# Altium project DIO_8SMA_8MCX_MEZZ.PrjPcb
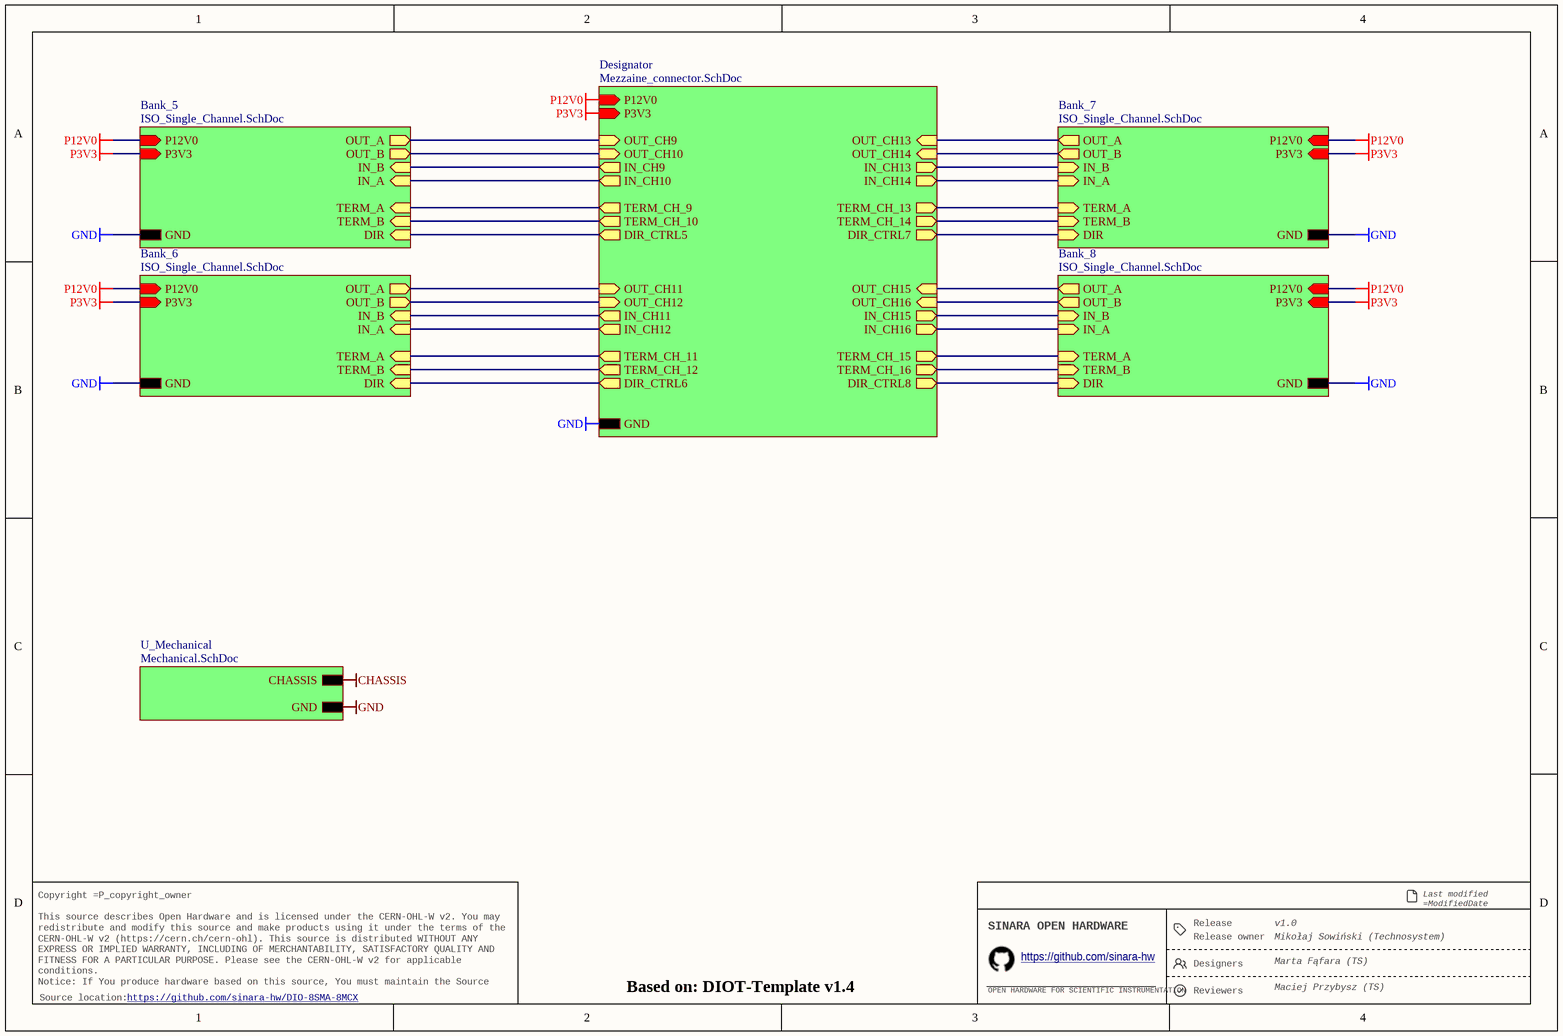
[diagram p0: DIO_8SMA_8MCX_MEZZ.SchDoc]
P_copyright_owner: Technosystem 2026; P_github_link: https://github.com/sinara-hw/DIO-8SMA-8MCX; P_release_designers: Marta Fąfara (TS); P_release_owner: Mikołaj Sowiński (Technosystem); P_release_reviewers: Maciej Przybysz (TS); P_template_version: 1.4; P_version: 1.0
6 sheets, 303 parts. Net scope: strictly hierarchical (ports join the sheet entries above them; power ports are local).
Board file: DIO_8SMA_8MCX_MEZZ.PcbDoc
Sheets:
  DIO_8SMA_8MCX_MEZZ.SchDoc
    Bank_5 = ISO_Single_Channel.SchDoc
      ISO_DCDC = ISO_DC_12_DC_5.SchDoc
      Bank = Iso_SMA_MCX_Channel.SchDoc
    Bank_6 = ISO_Single_Channel.SchDoc
      ISO_DCDC = ISO_DC_12_DC_5.SchDoc
      Bank = Iso_SMA_MCX_Channel.SchDoc
    Bank_7 = ISO_Single_Channel.SchDoc
      ISO_DCDC = ISO_DC_12_DC_5.SchDoc
      Bank = Iso_SMA_MCX_Channel.SchDoc
    Bank_8 = ISO_Single_Channel.SchDoc
      ISO_DCDC = ISO_DC_12_DC_5.SchDoc
      Bank = Iso_SMA_MCX_Channel.SchDoc
    U_Mechanical = Mechanical.SchDoc
    Designator = Mezzaine_connector.SchDoc

## Sheet DIO_8SMA_8MCX_MEZZ.SchDoc: =DocumentName
size A4; DocumentNumber: 1; Revision: 0; SheetNumber: 1; SheetTotal: 6

### Sub-sheets
Bank_5 = ISO_Single_Channel.SchDoc: P12V0 (in), GND, OUT_A (out), OUT_B (out), IN_B (in), IN_A (in), TERM_A (in), DIR (in), TERM_B (in), P3V3 (in)
Bank_6 = ISO_Single_Channel.SchDoc: P12V0 (in), GND, OUT_A (out), OUT_B (out), IN_B (in), IN_A (in), TERM_A (in), DIR (in), TERM_B (in), P3V3 (in)
Bank_7 = ISO_Single_Channel.SchDoc: P12V0 (in), GND, OUT_A (out), OUT_B (out), IN_B (in), IN_A (in), TERM_A (in), DIR (in), TERM_B (in), P3V3 (in)
Bank_8 = ISO_Single_Channel.SchDoc: P12V0 (in), GND, OUT_A (out), OUT_B (out), IN_B (in), IN_A (in), TERM_A (in), DIR (in), TERM_B (in), P3V3 (in)
Designator = Mezzaine_connector.SchDoc: P12V0 (in), P3V3 (in), GND, OUT_CH9 (in), IN_CH9 (out), TERM_CH_9 (out), DIR_CTRL5 (out), OUT_CH10 (in), IN_CH10 (out), TERM_CH_10 (out), OUT_CH13 (in), OUT_CH14 (in), IN_CH13 (out), IN_CH14 (out), TERM_CH_13 (out), TERM_CH_14 (out), DIR_CTRL7 (out), DIR_CTRL6 (out), TERM_CH_12 (out), TERM_CH_11 (out), IN_CH12 (out), IN_CH11 (out), OUT_CH12 (in), OUT_CH11 (in), DIR_CTRL8 (out), TERM_CH_16 (out), TERM_CH_15 (out), IN_CH16 (out), IN_CH15 (out), OUT_CH16 (in), OUT_CH15 (in)
U_Mechanical = Mechanical.SchDoc: CHASSIS, GND

### Nets
GND: sheet Bank_5/GND, sheet Bank_6/GND, sheet Bank_7/GND, sheet Bank_8/GND, sheet U_Mechanical/GND, sheet Designator/GND
P3V3: sheet Bank_5/P3V3, sheet Bank_6/P3V3, sheet Bank_7/P3V3, sheet Bank_8/P3V3, sheet Designator/P3V3
P12V0: sheet Bank_5/P12V0, sheet Bank_6/P12V0, sheet Bank_7/P12V0, sheet Bank_8/P12V0, sheet Designator/P12V0
DIR_CTRL5: sheet Bank_5/DIR, sheet Designator/DIR_CTRL5
DIR_CTRL6: sheet Bank_6/DIR, sheet Designator/DIR_CTRL6
DIR_CTRL7: sheet Bank_7/DIR, sheet Designator/DIR_CTRL7
DIR_CTRL8: sheet Bank_8/DIR, sheet Designator/DIR_CTRL8
IN_CH9: sheet Bank_5/IN_B, sheet Designator/IN_CH9
IN_CH10: sheet Bank_5/IN_A, sheet Designator/IN_CH10
IN_CH11: sheet Bank_6/IN_B, sheet Designator/IN_CH11
IN_CH12: sheet Bank_6/IN_A, sheet Designator/IN_CH12
IN_CH13: sheet Bank_7/IN_B, sheet Designator/IN_CH13
IN_CH14: sheet Bank_7/IN_A, sheet Designator/IN_CH14
IN_CH15: sheet Bank_8/IN_B, sheet Designator/IN_CH15
IN_CH16: sheet Bank_8/IN_A, sheet Designator/IN_CH16
OUT_CH9: sheet Bank_5/OUT_A, sheet Designator/OUT_CH9
OUT_CH10: sheet Bank_5/OUT_B, sheet Designator/OUT_CH10
OUT_CH11: sheet Bank_6/OUT_A, sheet Designator/OUT_CH11
OUT_CH12: sheet Bank_6/OUT_B, sheet Designator/OUT_CH12
OUT_CH13: sheet Bank_7/OUT_A, sheet Designator/OUT_CH13
OUT_CH14: sheet Bank_7/OUT_B, sheet Designator/OUT_CH14
OUT_CH15: sheet Bank_8/OUT_A, sheet Designator/OUT_CH15
OUT_CH16: sheet Bank_8/OUT_B, sheet Designator/OUT_CH16
TERM_CH_9: sheet Bank_5/TERM_A, sheet Designator/TERM_CH_9
TERM_CH_10: sheet Bank_5/TERM_B, sheet Designator/TERM_CH_10
TERM_CH_11: sheet Bank_6/TERM_A, sheet Designator/TERM_CH_11
TERM_CH_12: sheet Bank_6/TERM_B, sheet Designator/TERM_CH_12
TERM_CH_13: sheet Bank_7/TERM_A, sheet Designator/TERM_CH_13
TERM_CH_14: sheet Bank_7/TERM_B, sheet Designator/TERM_CH_14
TERM_CH_15: sheet Bank_8/TERM_A, sheet Designator/TERM_CH_15
TERM_CH_16: sheet Bank_8/TERM_B, sheet Designator/TERM_CH_16

### Notes on the sheet
- Release
- Last modified =ModifiedDate
  Sheet =sheetnumber of =sheettotal · Size A4
- Copyright =P_copyright_owner
  This source describes Open Hardware and is licensed under the CERN-OHL-W v2. You may redistribute and modify this source and make products using it under the terms of the CERN-OHL-W v2 (https://cern.ch/cern-ohl). This source is distributed WITHOUT ANY EXPRESS OR IMPLIED WARRANTY, INCLUDING OF MERCHANTABILITY, SATISFACTORY QUALITY AND FITNESS FOR A PARTICULAR PURPOSE. Please see the CERN-OHL-W v2 for applicable conditions.
  Notice: If You produce hardware based on this source, You must maintain the Source Location visible on the product, its packaging or its documentation.
- SINARA OPEN HARDWARE
- OPEN HARDWARE FOR SCIENTIFIC INSTRUMENTATION
- https://github.com/sinara-hw
- Release owner
- Designers
- Reviewers
- Source location:

## Sheet ISO_Single_Channel.SchDoc: =DocumentName
size A4; Version: 1.0; DocumentNumber: 1; Revision: 0; SheetNumber: 3; SheetTotal: 6
Used 4 times, as channels Bank_5, Bank_6, Bank_7, Bank_8. Parts and nets are listed once, with the designators drawn on the sheet.
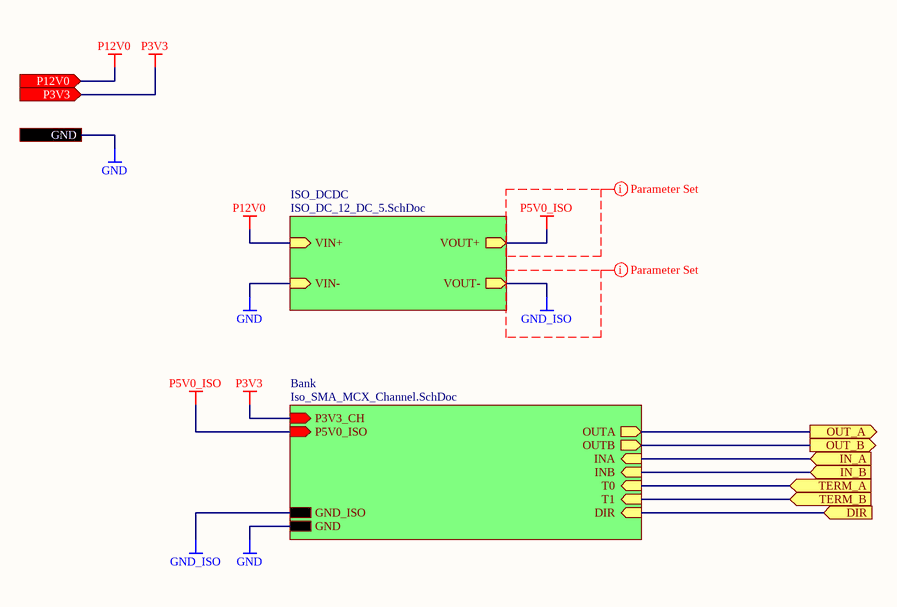
[diagram p1: ISO_Single_Channel.SchDoc]

### Sub-sheets
Bank = Iso_SMA_MCX_Channel.SchDoc: OUTA (out), OUTB (out), INA (in), INB (in), DIR (in), P3V3_CH (in), P5V0_ISO (in), GND_ISO, GND, T1 (in), T0 (in)
ISO_DCDC = ISO_DC_12_DC_5.SchDoc: VIN+ (in), VIN- (in), VOUT+ (out), VOUT- (out)

### Ports
DIR (in), GND, IN_A (in), IN_B (in), OUT_A (out), OUT_B (out), P3V3 (in), P12V0 (in), TERM_A (in), TERM_B (in)

### Nets
GND: port GND, sheet ISO_DCDC/VIN-, sheet Bank/GND
GND_ISO: sheet ISO_DCDC/VOUT-, sheet Bank/GND_ISO
P3V3: port P3V3, sheet Bank/P3V3_CH
P5V0_ISO: sheet ISO_DCDC/VOUT+, sheet Bank/P5V0_ISO
P12V0: port P12V0, sheet ISO_DCDC/VIN+
DIR: port DIR, sheet Bank/DIR
IN_A: port IN_A, sheet Bank/INA
IN_B: port IN_B, sheet Bank/INB
OUT_A: port OUT_A, sheet Bank/OUTA
OUT_B: port OUT_B, sheet Bank/OUTB
TERM_A: port TERM_A, sheet Bank/T0
TERM_B: port TERM_B, sheet Bank/T1

### Channels
Bank_5: ports DIR=DIR_CTRL5 GND=GND IN_A=IN_CH10 IN_B=IN_CH9 OUT_A=OUT_CH9 OUT_B=OUT_CH10 P3V3=P3V3 P12V0=P12V0 TERM_A=TERM_CH_9 TERM_B=TERM_CH_10
Bank_6: ports DIR=DIR_CTRL6 GND=GND IN_A=IN_CH12 IN_B=IN_CH11 OUT_A=OUT_CH11 OUT_B=OUT_CH12 P3V3=P3V3 P12V0=P12V0 TERM_A=TERM_CH_11 TERM_B=TERM_CH_12
Bank_7: ports DIR=DIR_CTRL7 GND=GND IN_A=IN_CH14 IN_B=IN_CH13 OUT_A=OUT_CH13 OUT_B=OUT_CH14 P3V3=P3V3 P12V0=P12V0 TERM_A=TERM_CH_13 TERM_B=TERM_CH_14
Bank_8: ports DIR=DIR_CTRL8 GND=GND IN_A=IN_CH16 IN_B=IN_CH15 OUT_A=OUT_CH15 OUT_B=OUT_CH16 P3V3=P3V3 P12V0=P12V0 TERM_A=TERM_CH_15 TERM_B=TERM_CH_16

### Layout directives
net class GND_ISO: GND_ISO
net class PWR_ISO: P5V0_ISO

### Notes on the sheet
- Release
- Last modified =ModifiedDate
  Sheet =sheetnumber of =sheettotal · Size A4
- Copyright =P_copyright_owner
  This source describes Open Hardware and is licensed under the CERN-OHL-W v2. You may redistribute and modify this source and make products using it under the terms of the CERN-OHL-W v2 (https://cern.ch/cern-ohl). This source is distributed WITHOUT ANY EXPRESS OR IMPLIED WARRANTY, INCLUDING OF MERCHANTABILITY, SATISFACTORY QUALITY AND FITNESS FOR A PARTICULAR PURPOSE. Please see the CERN-OHL-W v2 for applicable conditions.
  Notice: If You produce hardware based on this source, You must maintain the Source Location visible on the product, its packaging or its documentation.
- SINARA OPEN HARDWARE
- OPEN HARDWARE FOR SCIENTIFIC INSTRUMENTATION
- https://github.com/sinara-hw
- Release owner
- Designers
- Reviewers
- Source location:

## Sheet ISO_DC_12_DC_5.SchDoc: =DocumentName
size A4; ModifiedBy: -; CheckedDate: -; Title2: v1.0; DivGrp: WUT ISE; Designer: G.Kasprowicz; DocumentNumber: 1; Revision: 0; SheetNumber: 4; SheetTotal: 6
Used 4 times, as channels Bank_5/ISO_DCDC, Bank_6/ISO_DCDC, Bank_7/ISO_DCDC, Bank_8/ISO_DCDC. Parts and nets are listed once, with the designators drawn on the sheet.
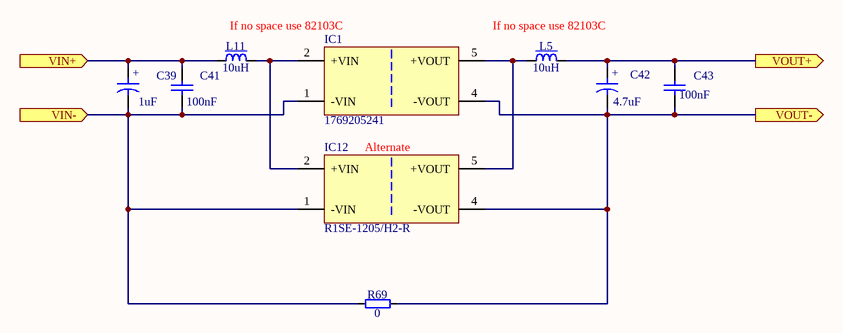
[diagram p2: ISO_DC_12_DC_5.SchDoc]

### Parts
C39  1uF  [CAPMP6032X280N]
C41  100nF  [CAPC1005X55N]
C42  4.7uF  [CAPMP3216X180N]
C43  100nF  [CAPC1005X55N]
IC1  1769205241  [WPME-FISM_SMT-8_L13.2W11.4H7.25]
IC12  R1SE-1205/H2-R  [R1SE-1205_H2-R]
L5  10uH  [IND_MURATA-PS_8400]
L11  10uH  [IND_MURATA-PS_8400]
R69  0  [RESC3216X65N]

### Ports
VIN+ (in), VIN- (in), VOUT+ (out), VOUT- (out)

### Nets
VIN+: C39.1 C41.2 L11.2 ; port VIN+
VIN-: C39.2 C41.1 IC1.1(-VIN) IC12.1(-VIN) R69.1 ; port VIN-
VOUT+: C42.1 C43.2 L5.1 ; port VOUT+
VOUT-: C42.2 C43.1 IC1.4(-VOUT) IC12.4(-VOUT) R69.2 ; port VOUT-
NetIC1_2: IC1.2(+VIN) IC12.2(+VIN) L11.1
NetIC1_5: IC1.5(+VOUT) IC12.5(+VOUT) L5.2

### Channels
Bank_5/ISO_DCDC: designators end in A; ports VIN+=P12V0 VIN-=GND VOUT+=P5V0_ISO VOUT-=GND_ISO
Bank_6/ISO_DCDC: designators end in B; ports VIN+=P12V0 VIN-=GND VOUT+=P5V0_ISO VOUT-=GND_ISO
Bank_7/ISO_DCDC: designators end in C; ports VIN+=P12V0 VIN-=GND VOUT+=P5V0_ISO VOUT-=GND_ISO
Bank_8/ISO_DCDC: designators end in D; ports VIN+=P12V0 VIN-=GND VOUT+=P5V0_ISO VOUT-=GND_ISO

### Notes on the sheet
- If no space use 82103C
- (near IC12) Alternate
- Release
- Last modified =ModifiedDate
  Sheet =sheetnumber of =sheettotal · Size A4
- Copyright =P_copyright_owner
  This source describes Open Hardware and is licensed under the CERN-OHL-W v2. You may redistribute and modify this source and make products using it under the terms of the CERN-OHL-W v2 (https://cern.ch/cern-ohl). This source is distributed WITHOUT ANY EXPRESS OR IMPLIED WARRANTY, INCLUDING OF MERCHANTABILITY, SATISFACTORY QUALITY AND FITNESS FOR A PARTICULAR PURPOSE. Please see the CERN-OHL-W v2 for applicable conditions.
  Notice: If You produce hardware based on this source, You must maintain the Source Location visible on the product, its packaging or its documentation.
- SINARA OPEN HARDWARE
- OPEN HARDWARE FOR SCIENTIFIC INSTRUMENTATION
- https://github.com/sinara-hw
- Release owner
- Designers
- Reviewers
- Source location:
- (in symbol CTE3216-18_4.7UF_16V_10%_LESR2000) +
- (in symbol CTE6032-28_1UF_50V_10%) +

### Library data of the parts
C39 = CTE6032-28_1UF_50V_10%: Polarised capacitor; Part Description: Solid Tantalum Chip Capacitor; Manufacturer: GENERIC; Manufacturer1 Part Number: TAJC105K050R; Voltage: 50V; Tolerance: ±10%; Part Number: CTE6032-28_1UF_50V_10%; Component Kind: Standard; Component Type: Standard; Pin Count: 2; Value: 1uF; Status: Preferred; Manufacturer Part Number: CTE6032-28_1UF_50V_10%; Case: C; Mounted: Yes; Socket: No; SMD: Yes; Sense: No; Manufacturer1 Example: AVX; Manufacturer1 ComponentHeight: 2.8mm; HelpURL: \\cern.ch\dfs\Applications\Altium\Datasheets\CTE_AVX_TAJ.pdf; Author: CERN DEM JLC; CreateDate: 03.12.2007; LatestRevisionDate: 03.12.2007
C41 C43 = CC0402_100NF_50V_10%_X7R: Non-polarised capacitor; Part Description: SMD Multilayer Chip Ceramic Capacitor; Manufacturer: GENERIC; Manufacturer1 Part Number: GRM155R71H104KE14D; Voltage: 50V; TC: X7R; Tolerance: ±10%; Part Number: CC0402_100NF_50V_10%_X7R; Component Kind: Standard; Component Type: Standard; Pin Count: 2; Value: 100nF; Status: None; Manufacturer Part Number: CC0402_100NF_50V_10%_X7R; Case: 0402; Mounted: Yes; Socket: No; SMD: Yes; Sense: No; HelpURL: \\cern.ch\dfs\Applications\Altium\Datasheets\CC0402_MURATA_GRM155R71H104KE14D.pdf; Author: CERN DEM MR; CreateDate: 30.06.2017; LatestRevisionDate: 30.06.2017; Manufacturer1 Example: MURATA; Manufacturer1 ComponentHeight: 0.55mm
C42 = CTE3216-18_4.7UF_16V_10%_LESR2000: Polarised capacitor; Part Description: Low ESR 2R0 Solid Tantalum Chip Capacitor; Manufacturer: GENERIC; Manufacturer1 Part Number: TPSA475K016R2000; Voltage: 16V; Tolerance: ±10%; Part Number: CTE3216-18_4.7UF_16V_10%_LESR2000; Component Kind: Standard; Component Type: Standard; Pin Count: 2; Value: 4.7uF; Status: Preferred; Manufacturer Part Number: CTE3216-18_4.7UF_16V_10%_LESR2000; Case: A; Mounted: Yes; Socket: No; SMD: Yes; Sense: No; Manufacturer1 Example: AVX; Manufacturer1 ComponentHeight: 1.8mm; HelpURL: \\cern.ch\dfs\Applications\Altium\Datasheets\CTE-LESR_AVX_TPS.pdf; Author: CERN DEM JLC; CreateDate: 03.09.2012; LatestRevisionDate: 03.09.2012
IC1 = CMP-019-00162-2: Dc-Dc Converter, 5V, 0.2A Rohs Compliant: Yes; Manufacturer: Wurth Elektronik; Isolation Voltage: 3kV; Output Current: 200mA; Max Supply Voltage: 13.2V; Height: 7.25mm; Manufacturer Part Search: 1769205241; Width: 11.4mm; Length: 13.2mm
IC12 = CMP-019-00163-2: 1W DC/DC-Converter 'ECONOLINE' SMD 2kV unreg; V. In: 12; V. Out: 05; mA. Out: 200; Manufacturer: RECOM Power; Output Voltage: 5V; Max Supply Voltage: 13.2V; Max Operating Temperature: 100°C; Min Operating Temperature: -40°C; Mounting Technology: Surface Mount; Case/Package: SMD/SMT; Manufacturer Part Number: R1SE-1205/H2-R; Height: 6.7mm; Max Power Dissipation: 1W
L5 L11 = IND_10UH_10%_MURATA-PS_8400: Inductor With Core; Part Description: Miniature Surface Mount Power Inductor (8400 Serie); Manufacturer: MURATA POWER SOLUTIONS; Manufacturer Part Number: 84103C; Power: 950mA; Resistance: 0.24R; Tolerance: ±10%; Part Number: IND_10UH_10%_MURATA-PS_8400; Component Kind: Standard; Component Type: Standard; Pin Count: 2; Value: 10uH; Status: None; Mounted: Yes; Socket: No; SMD: Yes; Sense: No; ComponentHeight: 2.9mm; HelpURL: \\cern.ch\dfs\Applications\Altium\Datasheets\IND_MURATA-PS_8400.pdf; Author: CERN DEM JLC; CreateDate: 02.07.2012; LatestRevisionDate: 02.07.2012
R69 = R1206_0R_JUMPER: Resistor; Part Description: 2A (0.05R Max DC Resistance) Zero Ohm Jumper; Manufacturer: GENERIC; Manufacturer1 Part Number: NRC12Z0; PressFit: No; Part Number: R1206_0R_JUMPER; Component Kind: Standard; Component Type: Standard; Pin Count: 2; Value: 0; Status: Preferred; Manufacturer Part Number: R1206_0R_JUMPER; Case: 1206; Mounted: Yes; Sense: No; Socket: No; SMD: Yes; Manufacturer1 Example: NIC COMPONENT; Manufacturer1 ComponentHeight: 0.65mm; HelpURL: \\cern.ch\dfs\Applications\Altium\Datasheets\R1206_NIC_NRC.pdf; Author: CERN DEM JLC; CreateDate: 03.12.2007; LatestRevisionDate: 13.03.2008

## Sheet Iso_SMA_MCX_Channel.SchDoc: =DocumentName
size A4; Version: 1.0; DocumentNumber: 1; Revision: 0; SheetNumber: 5; SheetTotal: 6
Used 4 times, as channels Bank_5/Bank, Bank_6/Bank, Bank_7/Bank, Bank_8/Bank. Parts and nets are listed once, with the designators drawn on the sheet.
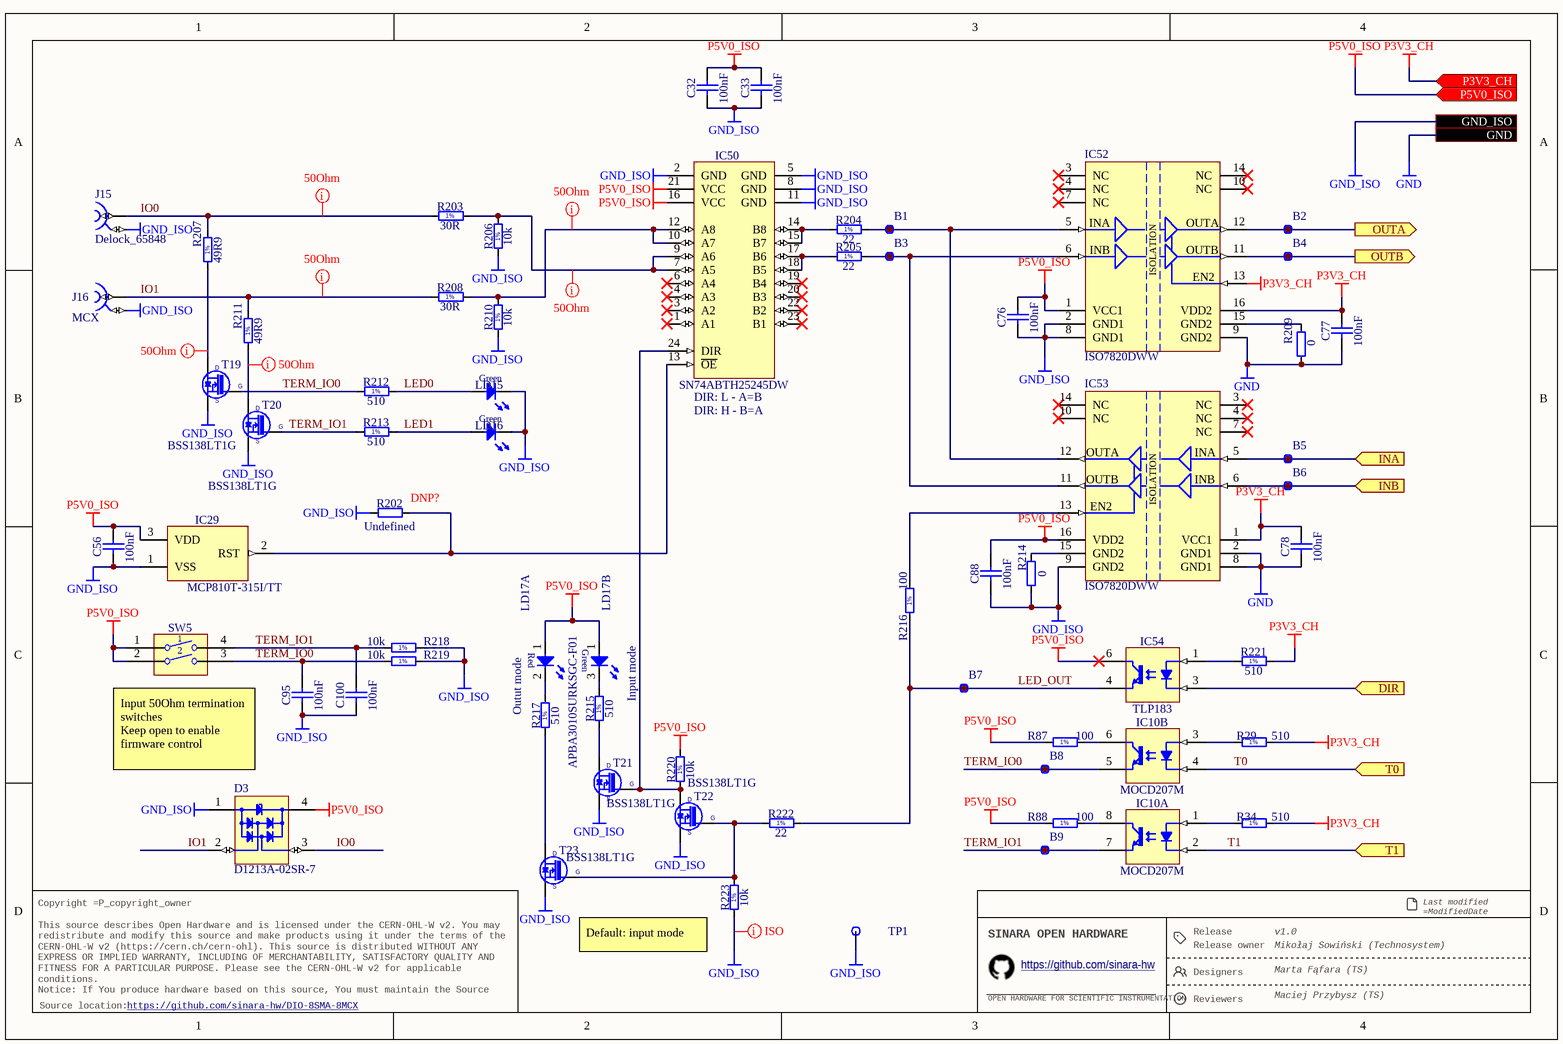
[diagram p3: Iso_SMA_MCX_Channel.SchDoc]

### Parts
B1  SMD Pad  [C100]  (value not drawn)  (no BOM)
B2  SMD Pad  [C100]  (value not drawn)  (no BOM)
B3  SMD Pad  [C100]  (value not drawn)  (no BOM)
B4  SMD Pad  [C100]  (value not drawn)  (no BOM)
B5  SMD Pad  [C100]  (value not drawn)  (no BOM)
B6  SMD Pad  [C100]  (value not drawn)  (no BOM)
B7  SMD Pad  [C100]  (value not drawn)  (no BOM)
B8  SMD Pad  [C100]  (value not drawn)  (no BOM)
B9  SMD Pad  [C100]  (value not drawn)  (no BOM)
C32  100nF  [CAPC1005X55N]
C33  100nF  [CAPC1005X55N]
C56  100nF  [CAPC1005X55N]
C76  100nF  [CAPC1005X55N]
C77  100nF  [CAPC1005X55N]
C78  100nF  [CAPC1005X55N]
C88  100nF  [CAPC1005X55N]
C95  100nF  [CAPC1005X55N]
C100  100nF  [CAPC1005X55N]
D3  D1213A-02SR-7  [SOT190P238X100-4N]
IC10  MOCD207M  [SOIC127P594X363-8N]  (parts A,B of 2)
IC29  MCP810T-315I/TT  [SOT95P237X112-3N]
IC50  SN74ABTH25245DW  [SOIC127P1030X265-24N]
IC52  ISO7820DWW  [SOIC127P1720X265-16N]
IC53  ISO7820DWW  [SOIC127P1720X265-16N]
IC54  TLP183  [TOSHIBA_11-4M1S]
J15  Delock_65848  [Delock_65848]
J16  MCX  [AMPHENOL_919-383J-51A]
LD15  Green  [LED_AVAGO_HSME-C120]
LD16  Green  [LED_AVAGO_HSME-C120]
LD17  APBA3010SURKSGC-F01  [APBA3010SURKSGC-F01]  (parts A,B of 2)
R29  510  [RESC1005X40N]
R34  510  [RESC1005X40N]
R87  100  [RESC1005X40N]
R88  100  [RESC1005X40N]
R202  Undefined  [RESC1005X40N]
R203  30R  [RESC3225X70N]
R204  22  [RESC1005X40N]
R205  22  [RESC1005X40N]
R206  10k  [RESC1005X40N]
R207  49R9  [RESC3225X70N]
R208  30R  [RESC3225X70N]
R209  0  [RESC1005X40N]
R210  10k  [RESC1005X40N]
R211  49R9  [RESC3225X70N]
R212  510  [RESC1005X40N]
R213  510  [RESC1005X40N]
R214  0  [RESC1005X40N]
R215  510  [RESC1005X40N]
R216  100  [RESC1005X40N]
R217  510  [RESC1005X40N]
R218  10k  [RESC1005X40N]
R219  10k  [RESC1005X40N]
R220  10k  [RESC1005X40N]
R221  510  [RESC1005X40N]
R222  22  [RESC1005X40N]
R223  10k  [RESC1005X40N]
SW5  Switch  [SW_OMRON_A6S-2102-H]  (value not drawn)
T19  BSS138LT1G  [SOT95P240X110-3N]
T20  BSS138LT1G  [SOT95P240X110-3N]
T21  BSS138LT1G  [SOT95P240X110-3N]
T22  BSS138LT1G  [SOT95P240X110-3N]
T23  BSS138LT1G  [SOT95P240X110-3N]
TP1  Plated Hole  [c150h100]  (value not drawn)  (no BOM)

### Ports
DIR (in), GND, GND_ISO, INA (in), INB (in), OUTA (out), OUTB (out), P3V3_CH (in), P5V0_ISO (in), T0 (in), T1 (in)

### Nets
GND: C77.1 C78.1 IC52.9(GND2) IC53.2(GND1) IC53.8(GND1) R209.2 ; port GND
GND_ISO: C32.1 C33.1 C56.1 C76.1 C88.1 C95.1 C100.1 D3.1(GND) IC29.1(VSS) IC50.2(GND) IC50.5(GND) IC50.8(GND) IC50.11(GND) IC52.2(GND1) IC52.8(GND1) IC53.9(GND2) J15.2 J16.2 LD15.1(C) LD16.1(C) R202.1 R206.1 R210.1 R214.1 R218.2 R219.2 R223.1 T19.2(S) T20.2(S) T21.2(S) T22.2(S) T23.2(S) TP1.1 ; port GND_ISO
P3V3_CH: C77.2 C78.2 IC52.13(EN2) IC52.16(VDD2) IC53.1(VCC1) R29.2 R34.2 R221.2 ; port P3V3_CH
P5V0_ISO: C32.2 C33.2 C56.2 C76.2 C88.2 D3.4(VCC) IC29.3(VDD) IC50.16(VCC) IC50.21(VCC) IC52.1(VCC1) IC53.16(VDD2) IC54.6(C) LD17.1(A) R87.1 R88.1 R220.2 SW5.1 SW5.2 ; port P5V0_ISO
DIR: IC54.3(C) ; port DIR
INA: B5.1 IC53.5(INA) ; port INA
INB: B6.1 IC53.6(INB) ; port INB
IO0: D3.3(I/O2) J15.1 R203.1 R207.2
IO1: D3.2(I/O1) J16.1 R208.1 R211.2
LED0: LD15.2(A) R212.2
LED1: LD16.2(A) R213.2
LED_OUT: B7.1 IC54.4(E) R216.1 R222.2
OUTA: B2.1 IC52.12(OUTA) ; port OUTA
OUTB: B4.1 IC52.11(OUTB) ; port OUTB
T0: IC10.4(K) ; port T0
T1: IC10.2(K) ; port T1
TERM_IO0: B8.1 C95.2 IC10.5(E) R212.1 R219.1 SW5.3 T19.1(G)
TERM_IO1: B9.1 C100.2 IC10.7(E) R213.1 R218.1 SW5.4 T20.1(G)
NetB1_1: B1.1 IC52.5(INA) IC53.12(OUTA) R204.2
NetB3_1: B3.1 IC52.6(INB) IC53.11(OUTB) R205.2
NetIC10_1: IC10.1(A) R34.1
NetIC10_3: IC10.3(A) R29.1
NetIC10_6: IC10.6(C) R87.2
NetIC10_8: IC10.8(C) R88.2
NetIC29_2: IC29.2(RST) IC50.13(~{OE}) R202.2
NetIC50_7: IC50.7(A5) IC50.9(A6) R203.2 R206.2
NetIC50_10: IC50.10(A7) IC50.12(A8) R208.2 R210.2
NetIC50_14: IC50.14(B8) IC50.15(B7) R204.1
NetIC50_17: IC50.17(B6) IC50.18(B5) R205.1
NetIC50_24: IC50.24(DIR) R220.1 T21.1(G) T22.3(D)
NetIC52_15: IC52.15(GND2) R209.1
NetIC53_13: IC53.13(EN2) R216.2
NetIC53_15: IC53.15(GND2) R214.2
NetIC54_1: IC54.1(A) R221.1
NetLD17_2: LD17.2(C) R217.2
NetLD17_3: LD17.3(C) R215.2
NetR207_1: R207.1 T19.3(D)
NetR211_1: R211.1 T20.3(D)
NetR215_1: R215.1 T21.3(D)
NetR217_1: R217.1 T23.3(D)
NetR222_1: R222.1 R223.2 T22.1(G) T23.1(G)

Not connected (* = marked no-connect by the designer): IC50 1(A1)* 3(A2)* 4(A3)* 6(A4)* 19(B4)* 20(B3)* 22(B2)* 23(B1)*; IC52 3(NC)* 4(NC)* 7(NC)* 10(NC)* 14(NC)*; IC53 3(NC)* 4(NC)* 7(NC)* 10(NC)* 14(NC)*

### Channels
Bank_5/Bank: designators end in A; ports DIR=DIR_CTRL5 GND=GND GND_ISO=GND_ISO INA=IN_CH10 INB=IN_CH9 OUTA=OUT_CH9 OUTB=OUT_CH10 P3V3_CH=P3V3 P5V0_ISO=P5V0_ISO T0=TERM_CH_9 T1=TERM_CH_10
Bank_6/Bank: designators end in B; ports DIR=DIR_CTRL6 GND=GND GND_ISO=GND_ISO INA=IN_CH12 INB=IN_CH11 OUTA=OUT_CH11 OUTB=OUT_CH12 P3V3_CH=P3V3 P5V0_ISO=P5V0_ISO T0=TERM_CH_11 T1=TERM_CH_12
Bank_7/Bank: designators end in C; ports DIR=DIR_CTRL7 GND=GND GND_ISO=GND_ISO INA=IN_CH14 INB=IN_CH13 OUTA=OUT_CH13 OUTB=OUT_CH14 P3V3_CH=P3V3 P5V0_ISO=P5V0_ISO T0=TERM_CH_13 T1=TERM_CH_14
Bank_8/Bank: designators end in D; ports DIR=DIR_CTRL8 GND=GND GND_ISO=GND_ISO INA=IN_CH16 INB=IN_CH15 OUTA=OUT_CH15 OUTB=OUT_CH16 P3V3_CH=P3V3 P5V0_ISO=P5V0_ISO T0=TERM_CH_15 T1=TERM_CH_16

### Layout directives
net class GND_ISO: GND_ISO
net class 50Ohm: IO0_Bank, IO1_Bank, NetIC50A_7, NetIC50A_10, NetR207A_1, NetR211A_1

### Notes on the sheet
- (near IC50) DIR: L - A=B
- (near IC50) DIR: H - B=A
- (near R202) DNP?
- Outut mode
- Input mode
- Input 50Ohm termination switches
  Keep open to enable firmware control
- Default: input mode
- Release
- Last modified =ModifiedDate
  Sheet =sheetnumber of =sheettotal · Size A4
- Copyright =P_copyright_owner
  This source describes Open Hardware and is licensed under the CERN-OHL-W v2. You may redistribute and modify this source and make products using it under the terms of the CERN-OHL-W v2 (https://cern.ch/cern-ohl). This source is distributed WITHOUT ANY EXPRESS OR IMPLIED WARRANTY, INCLUDING OF MERCHANTABILITY, SATISFACTORY QUALITY AND FITNESS FOR A PARTICULAR PURPOSE. Please see the CERN-OHL-W v2 for applicable conditions.
  Notice: If You produce hardware based on this source, You must maintain the Source Location visible on the product, its packaging or its documentation.
- SINARA OPEN HARDWARE
- OPEN HARDWARE FOR SCIENTIFIC INSTRUMENTATION
- https://github.com/sinara-hw
- Release owner
- Designers
- Reviewers
- Source location:
- (in symbol CMP-007-00060-1, part A) Red
- (in symbol CMP-007-00060-1, part B) Green
- (in symbol CMP-015-00012-2) ISOLATION
- (in symbol R0402_10K_1%_0.0625W_100PPM) 1%
- (in symbol R0402_22R_1%_0.0625W_100PPM) 1%
- (in symbol R0402_100R_1%_0.1W_100PPM) 1%
- (in symbol R0402_510R_1%_0.0625W_100PPM) 1%
- (in symbol R1210_30R_5%_0.5W_200PPM) 1%
- (in symbol R1210_49R9_1%_0.5W_100PPM_VISHAY_CRCW) 1%

### Library data of the parts
B1-B9 = SMD_PAD_D1MM: Through Hole Pad; Part Description: 1mm Diameter SMD Pad; Mounted: No; Part Number: SMD_PAD_D1MM; Component Type: Standard (No BOM); Pin Count: 1; Family: SMD Pad; Socket: No; SMD: No; Sense: No; Status: None; ComponentHeight: 0mm; HelpURL: Undefined; Author: CERN DEM JLC; CreateDate: 10.10.2017; LatestRevisionDate: 10.10.2017; PackageDescription: 1mm Diameter SMD Pad
C32 C33 C56 C76-C78 C88 C95 C100 = CC0402_100NF_50V_10%_X7R: as C41 on sheet ISO_DC_12_DC_5; Part Number: CC0402_100NF_50V_10%_X7R; Component Kind: Standard; Component Type: Standard; Pin Count: 2; Value: 100nF; Status: None; Manufacturer Part Number: CC0402_100NF_50V_10%_X7R; Case: 0402; Mounted: Yes; Socket: No; SMD: Yes; Sense: No; HelpURL: \\cern.ch\dfs\Applications\Altium\Datasheets\CC0402_MURATA_GRM155R71H104KE14D.pdf; Author: CERN DEM MR; CreateDate: 30.06.2017; LatestRevisionDate: 30.06.2017; Manufacturer1 Example: MURATA; Manufacturer1 ComponentHeight: 0.55mm
D3 = CMP-004-00039-1: D1213A-02SR Series 400 mW Uni-Directional Surface Mount TVS Diode - SOT-143; Mounting Technology: Surface Mount; Case/Package: SOT-143; Max Operating Temperature: 150°C; Pins: 4; Min Operating Temperature: -65°C
IC10 = MOCD207M: Dual Optocoupler; Part Description: Dual-Channel Phototransistor Output Optocoupler; Manufacturer: ON SEMICONDUCTOR; PressFit: No; Bonding: No; Part Number: MOCD207M; Component Kind: Standard; Component Type: Standard; Device: MOCD207M; PackageDescription: SOIC, 1.27mm Pitch; 8 Pin, 3.91mm W X 4.88mm L, IPC Medium Density; Manufacturer Part Number: MOCD207M; Pin Count: 8; Case: SOIC8; Mounted: Yes; Socket: No; SMD: Yes; Sense: No; ComponentHeight: 3.63mm; HelpURL: \\cern.ch\dfs\Applications\Altium\Datasheets\MOCD207M.pdf; Author: CERN DEM JLC; CreateDate: 03.10.2017; LatestRevisionDate: 03.10.2017
IC29 = VMON_MCP810: 3.075V Microcontroller Supervisory Circuit With Push-Pull Output; Manufacturer: MICROCHIP TECHNOLOGY; PressFit: No; Bonding: No; Part Number: MCP810T-315I/TT; Component Kind: Standard; Component Type: Standard; Device: MCP810T-315I/TT; PackageDescription: SOT, 0.95mm, pitch; 3 pin,1.30mm W X 2.92mm L X 1.12mm H body, IPC Medium Density; Part Description: 3.075V Microcontroller Supervisory Circuit With Push-Pull Output; Manufacturer Part Number: MCP810T-315I/TT; Pin Count: 3; Case: SOT23; Mounted: Yes; Socket: No; SMD: Yes; Sense: No; ComponentHeight: 1.12mm; Author: GK; HelpURL: \\cern.ch\dfs\Applications\Altium\Datasheets\MCP809T-315I-TT.pdf; CreateDate: 16.06.2011; LatestRevisionDate: 16.06.2011
IC50 = SN74ABTH25245DW: 25 Ohms Octal Bus Transceiver With 3-State Outputs; Manufacturer: TEXAS INSTRUMENTS; PressFit: No; Bonding: No; Part Number: SN74ABTH25245DW; Component Kind: Standard; Component Type: Standard; Device: SN74ABTH25245DW; PackageDescription: SOIC 24, Pitch 1.27mm - Body 7.6x15.6mm, IPC Medium Density; Part Description: 25 Ohms Octal Bus Transceiver with 3-State Outputs; Manufacturer Part Number: SN74ABTH25245DW; Pin Count: 24; Case: SOIC24; Mounted: Yes; Socket: No; SMD: Yes; Sense: No; ComponentHeight: 2.65mm; Author: CERN DEM JLC; HelpURL: \\cern.ch\dfs\Applications\Altium\Datasheets\SN74ABTH25245DW.pdf; CreateDate: 03.04.2017; LatestRevisionDate: 03.04.2017
IC52 IC53 = CMP-015-00012-2: Highest isolation rating, dual-channel, 2/0, reinforced digital isolator 16-SOIC -55 to 125; Manufacturer: Texas Instruments; Max Supply Voltage: 5.5V; Min Supply Voltage: 2.25V; Manufacturer Part Number: ISO7820DWW; Pins: 16; Min Operating Temperature: -55°C; Case/Package: SOIC; Max Operating Temperature: 125°C
IC54 = TLP183: Single Optocoupler; Part Description: Photocoupler InGaAs Infrared LED & Photo-Transistor; Manufacturer: TOSHIBA; PressFit: No; Bonding: No; Part Number: TLP183; Component Kind: Standard; Component Type: Standard; Device: TLP183; PackageDescription: SOIC, 1.27mm Pitch; 4 Pin, TOSHIBA Case (5mm Creepage); Manufacturer Part Number: TLP183; Pin Count: 4; Case: SOIC4; Mounted: Yes; Socket: No; SMD: Yes; Sense: No; ComponentHeight: 2.3mm; HelpURL: \\cern.ch\dfs\Applications\Altium\Datasheets\TLP183.pdf; Author: CERN DEM JMW; CreateDate: 05.10.2015; LatestRevisionDate: 04.09.2017
J15 = CMP-002-04652-5: SMA connector Delock 65848
J16 = AMPHENOL_919-383J-51A: Part Description: 50 Ohm, RF Connector, MCX Right Angle PCB Receptacle Jack; PressFit: No; Part Number: AMPHENOL_919-383J-51A; Component Kind: Standard; Component Type: Standard; Pin Count: 5; Family: MCX; Mounted: Yes; Socket: No; SMD: No; Sense: No; Status: None; Manufacturer: AMPHENOL; Manufacturer Part Number: 919-383J-51A; ComponentHeight: 6mm; HelpURL: \\cern.ch\dfs\Applications\Altium\Datasheets\AMPHENOL_919-383J-51A.pdf; Author: CERN DEM BC; CreateDate: 31.01.2019; LatestRevisionDate: 31.01.2019
LD15 LD16 = LED_AVAGO_HSME-C120: LED Green 1C 2A; Part Description: High Performance Right Angle Chip Green LED; Manufacturer: AVAGO TECHNOLOGIES; PressFit: No; Bonding: No; Manufacturer Part Number: HSME-C120; ComponentHeight: 0.7mm; HelpURL: \\cern.ch\dfs\Applications\Altium\Datasheets\LED_AVAGO_HSME-C120.pdf; Part Number: LED_AVAGO_HSME-C120; Component Kind: Standard; Component Type: Standard; Color: Green; PackageDescription: Green Chip LED, 2-Leads, Body 1.7x1.1mm, Side Emitting Package; Pin Count: 2; Mounted: Yes; Socket: No; SMD: Yes; Sense: No; Author: CERN DEM JMW; CreateDate: 22.07.2009; LatestRevisionDate: 20.06.2012; ComponentLink1URL: \\cern.ch\dfs\Applications\Altium\Datasheets\LED_AVAGO_HSME-C110_DESIGN-GUIDE.pdf; ComponentLink1Description: Design Guide
LD17 = CMP-007-00060-1: Dual Color LED, Hyper Red/super Bright Green, Water Clear, 2mm; Manufacturer: Kingbright; Forward Voltage: 2.2V; Manufacturer Part Number: APBA3010SURKSGC-F01; Mounting Technology: Surface Mount; Max Operating Temperature: 85°C; Min Operating Temperature: -40°C; Case/Package: SMD/SMT
R29 R34 R212 R213 R215 R217 R221 = R0402_510R_1%_0.0625W_100PPM: Resistor - 1%; Part Description: General Purpose Thick Film Chip Resistor; Manufacturer: GENERIC; Manufacturer1 Part Number: 232270675101L; TC: ±100ppm/°C; Part Number: R0402_510R_1%_0.0625W_100PPM; Component Kind: Standard; Component Type: Standard; Pin Count: 2; Value: 510; Status: Not recommended; Power: 0.0625W; Tolerance: ±1%; Manufacturer Part Number: R0402_510R_1%_0.0625W_100PPM; Case: 0402; Mounted: Yes; Sense: No; Socket: No; SMD: Yes; Manufacturer1 Example: YAGEO PHYCOMP; Manufacturer1 ComponentHeight: 0.4mm; HelpURL: \\cern.ch\dfs\Applications\Altium\Datasheets\R0402_Phycomp_RC0402.pdf; Author: CERN DEM JLC; CreateDate: 03.12.2007; LatestRevisionDate: 17.10.2012
R87 R88 R216 = R0402_100R_1%_0.1W_100PPM: Resistor - 1%; Part Description: General Purpose Thick Film Chip Resistor; Manufacturer: GENERIC; Manufacturer Part Number: R0402_100R_1%_0.1W_100PPM_50V; Manufacturer1 Part Number: ERJ2RKF1000X; Power: 0.1W; TC: ±100ppm/°C; Voltage: 50V; Part Number: R0402_100R_1%_0.1W_100PPM; Component Kind: Standard; Component Type: Standard; Pin Count: 2; Value: 100; Status: Not recommended; Tolerance: ±1%; Case: 0402; Mounted: Yes; Sense: No; Socket: No; SMD: Yes; Manufacturer1 Example: PANASONIC; Manufacturer1 ComponentHeight: 0.4mm; HelpURL: \\cern.ch\dfs\Applications\Altium\Datasheets\R0402_PANASONIC_ERJ2RK.pdf; Author: CERN DEM JLC; CreateDate: 12.12.2013; LatestRevisionDate: 03.03.2015
R202 = R0402_NO-VALUE: Resistor; Part Description: Reserved Footprint For a 0402 (1005) Chip Resistor; PressFit: No; Mounted: No; Part Number: R0402_NO-VALUE; Component Kind: Standard; Component Type: Standard; Pin Count: 2; Value: Undefined; Status: None; Manufacturer: Undefined; Manufacturer Part Number: R0402_NO-VALUE; Case: 0402; Sense: No; Socket: No; SMD: Yes; Manufacturer1 Example: Undefined; Manufacturer1 Part Number: Undefined; Manufacturer1 ComponentHeight: Undefined; HelpURL: Undefined; Author: CERN DEM JLC; CreateDate: 03.12.2007; LatestRevisionDate: 13.03.2008
R203 R208 = R1210_30R_5%_0.5W_200PPM: Resistor - 5%; Part Description: Thick Film Chip Resistor; Manufacturer: VISHAY; Manufacturer Part Number: CRCW121030R0JNEA; Power: 0.5W; TC: ±200ppm/°C; PressFit: No; Part Number: R1210_30R_5%_0.5W_200ppm; Component Kind: Standard; Component Type: Standard; Pin Count: 2; Value: 30R; Status: None; Tolerance: ±5%; Case: 1210; Mounted: Yes; Sense: No; Socket: No; SMD: Yes; HelpURL: \\cern.ch\dfs\Applications\Altium\Datasheets\R1210_VISHAY_CRCW1210.pdf; Author: CERN DEM JMW; CreateDate: 06.08.2014; LatestRevisionDate: 06.08.2014; ComponentHeight: 0.6mm
R204 R205 R222 = R0402_22R_1%_0.0625W_100PPM: Resistor - 1%; Part Description: General Purpose Thick Film Chip Resistor; Manufacturer: GENERIC; Manufacturer1 Part Number: 232270672209L; TC: ±100ppm/°C; PressFit: No; Part Number: R0402_22R_1%_0.0625W_100PPM; Component Kind: Standard; Component Type: Standard; Pin Count: 2; Value: 22; Status: Not Recommended; Power: 0.0625W; Tolerance: ±1%; Manufacturer Part Number: R0402_22R_1%_0.0625W_100PPM; Case: 0402; Mounted: Yes; Sense: No; Socket: No; SMD: Yes; Manufacturer1 Example: YAGEO PHYCOMP; Manufacturer1 ComponentHeight: 0.4mm; HelpURL: \\cern.ch\dfs\Applications\Altium\Datasheets\R0402_Phycomp_RC0402.pdf; Author: CERN DEM JLC; CreateDate: 03.12.2007; LatestRevisionDate: 17.10.2012
R206 R210 R218-R220 R223 = R0402_10K_1%_0.0625W_100PPM: Resistor - 1%; Part Description: General Purpose Thick Film Chip Resistor; Manufacturer: GENERIC; Manufacturer1 Part Number: 232270671003L; TC: ±100ppm/°C; Part Number: R0402_10K_1%_0.0625W_100PPM; Component Kind: Standard; Component Type: Standard; Pin Count: 2; Value: 10k; Status: Not recommended; Power: 0.0625W; Tolerance: ±1%; Manufacturer Part Number: R0402_10K_1%_0.0625W_100PPM; Case: 0402; Mounted: Yes; Sense: No; Socket: No; SMD: Yes; Manufacturer1 Example: YAGEO PHYCOMP; Manufacturer1 ComponentHeight: 0.4mm; HelpURL: \\cern.ch\dfs\Applications\Altium\Datasheets\R0402_Phycomp_RC0402.pdf; Author: CERN DEM JLC; CreateDate: 03.12.2007; LatestRevisionDate: 17.10.2012
R207 R211 = R1210_49R9_1%_0.5W_100PPM_VISHAY_CRCW: Resistor - 1%; Part Description: Thick Film Chip Resistor; Manufacturer: VISHAY DRALORIC; Manufacturer Part Number: CRCW121049R9FKTA; Power: 0.5W; TC: ±100ppm/°C; Part Number: R1210_49R9_1%_0.5W_100PPM_VISHAY_CRCW; Component Kind: Standard; Component Type: Standard; Pin Count: 2; Value: 49R9; Status: None; Tolerance: ±1%; Case: 1210; Mounted: Yes; Sense: No; Socket: No; SMD: Yes; ComponentHeight: 0.6mm; HelpURL: \\cern.ch\dfs\Applications\Altium\Datasheets\R1210_VISHAY_CRCW1210.pdf; Author: CERN DEM JMW; CreateDate: 06.08.2014; LatestRevisionDate: 06.08.2014
R209 R214 = R0402_0R_JUMPER: Resistor; Part Description: 1A (0.05R Max DC Resistance) Zero Ohm Jumper; Manufacturer: GENERIC; Manufacturer1 Part Number: 232270591001L; PressFit: No; Part Number: R0402_0R_JUMPER; Component Kind: Standard; Component Type: Standard; Pin Count: 2; Value: 0; Status: Not Recommended; Manufacturer Part Number: R0402_0R_JUMPER; Case: 0402; Mounted: Yes; Sense: No; Socket: No; SMD: Yes; Manufacturer1 Example: YAGEO PHYCOMP; Manufacturer1 ComponentHeight: 0.4mm; HelpURL: \\cern.ch\dfs\Applications\Altium\Datasheets\R0402_Phycomp_RC0402.pdf; Author: CERN DEM JLC; CreateDate: 03.12.2007; LatestRevisionDate: 17.10.2012
SW5 = SW_OMRON_A6S-2102-H: 2 Ways SPST DIP Switch; Part Description: 2 Ways SPST DIP Switch, White Flat Actuator with Seal Tape, Contact Rating 25mA 24VDC; Manufacturer: OMRON; PressFit: No; Part Number: SW_OMRON_A6S-2102-H; Component Kind: Standard; Component Type: Standard; Pin Count: 4; PackageDescription: Pitch 2.54mm, Body 6.2x6.4mm, 2 Ways SPST Surface-Mounting DIP Switch, OMRON A6S-H; Family: Switch; Mounted: Yes; Socket: No; SMD: Yes; Sense: No; Status: None; Manufacturer Part Number: A6S-2102-H; ComponentHeight: 3.8mm; HelpURL: \\cern.ch\dfs\Applications\Altium\Datasheets\SW_OMRON_A6S-2102-H.pdf; Author: CERN DEM JMW; CreateDate: 25.09.2008; LatestRevisionDate: 25.09.2008
T19-T23 = BSS138LT1G: N-CHANNEL MOSFET WITH DIODE; Part Description: 50V 200mA N-Channel Enhancement Mode Field-Effect Transistor; Manufacturer: ON SEMICONDUCTOR; PressFit: No; Bonding: No; Part Number: BSS138LT1G; Component Kind: Standard; Component Type: Standard; Device: BSS138LT1G; PackageDescription: SOT23 3-Leads, Pitch 0.95mm - Body 1.4x3mm, IPC Medium Density; Manufacturer Part Number: BSS138LT1G; Pin Count: 3; Case: SOT23-3; Mounted: Yes; Socket: No; SMD: Yes; Sense: No; ComponentHeight: 1.11mm; HelpURL: \\cern.ch\dfs\Applications\Altium\Datasheets\BSS138LT1G.pdf; Author: CERN DEM JLC; CreateDate: 23.03.2009; LatestRevisionDate: 23.03.2009
TP1 = PLATED_HOLE1.0_PAD1.5: Single Terminal Socket; Part Description: Plated Through Hole: Hole Dia.=1mm Pad Dia.=1.5mm,  IPC-7251 Level C; Mounted: No; Part Number: PLATED_HOLE1.0_PAD1.5; Component Type: Standard (No BOM); Pin Count: 1; Family: Plated Hole; Socket: No; SMD: No; Sense: No; Status: None; ComponentHeight: 0mm; HelpURL: Undefined; Author: CERN DEM JLC; CreateDate: 30/10/2008; LatestRevisionDate: 30/10/2008; PackageDescription: Plated Through Hole: Hole Dia.=1mm Pad Dia.=1.5mm,  IPC-7251 Level C

## Sheet Mechanical.SchDoc: =DocumentName
size A4; DocumentNumber: 1; Revision: 0; SheetNumber: 2; SheetTotal: 6
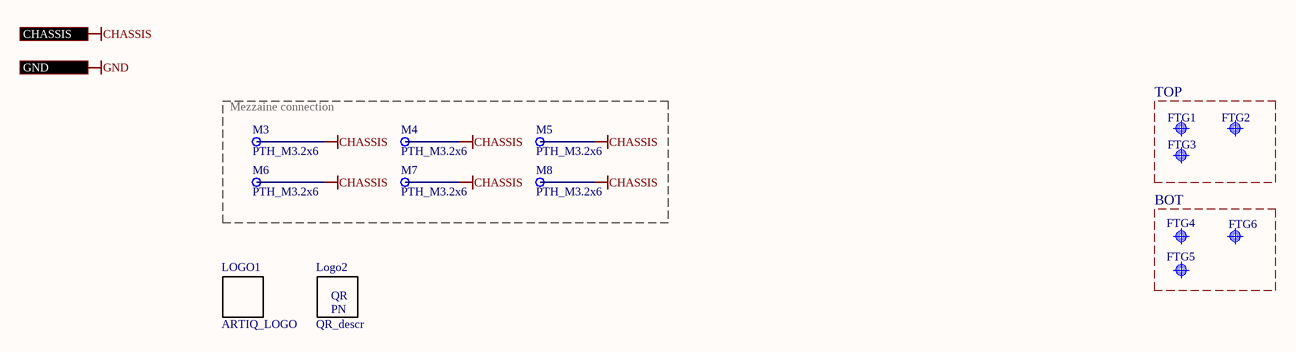
[diagram p4: Mechanical.SchDoc]

### Parts
FTG1  Use only in PCB  [FIDUCIAL_TOP_C100-200]  (value not drawn)
FTG2  Use only in PCB  [FIDUCIAL_TOP_S100-200]  (value not drawn)
FTG3  Use only in PCB  [FIDUCIAL_TOP_S100-200]  (value not drawn)
FTG4  Use only in PCB  [FIDUCIAL_TOP_S100-200]  (value not drawn)
FTG5  Use only in PCB  [FIDUCIAL_TOP_C100-200]  (value not drawn)
FTG6  Use only in PCB  [FIDUCIAL_TOP_S100-200]  (value not drawn)
LOGO1  ARTIQ_LOGO  [ARTIQ_Logo]  (no BOM)
Logo2  QR_descr  [QR_descr]  (no BOM)
M3  PTH_M3.2x6  [PTH_3,2x6]
M4  PTH_M3.2x6  [PTH_3,2x6]
M5  PTH_M3.2x6  [PTH_3,2x6]
M6  PTH_M3.2x6  [PTH_3,2x6]
M7  PTH_M3.2x6  [PTH_3,2x6]
M8  PTH_M3.2x6  [PTH_3,2x6]

### Blocks framed on the sheet
Mezzaine connection: M3-M8
TOP: FTG1-FTG3
BOT: FTG4-FTG6

### Ports
CHASSIS, GND

### Nets
CHASSIS: M3.1 M4.1 M5.1 M6.1 M7.1 M8.1 ; port CHASSIS

### Notes on the sheet
- Release
- Last modified =ModifiedDate
  Sheet =sheetnumber of =sheettotal · Size A4
- Copyright =P_copyright_owner
  This source describes Open Hardware and is licensed under the CERN-OHL-W v2. You may redistribute and modify this source and make products using it under the terms of the CERN-OHL-W v2 (https://cern.ch/cern-ohl). This source is distributed WITHOUT ANY EXPRESS OR IMPLIED WARRANTY, INCLUDING OF MERCHANTABILITY, SATISFACTORY QUALITY AND FITNESS FOR A PARTICULAR PURPOSE. Please see the CERN-OHL-W v2 for applicable conditions.
  Notice: If You produce hardware based on this source, You must maintain the Source Location visible on the product, its packaging or its documentation.
- SINARA OPEN HARDWARE
- OPEN HARDWARE FOR SCIENTIFIC INSTRUMENTATION
- https://github.com/sinara-hw
- Release owner
- Designers
- Reviewers
- Source location:
- (in symbol R0805_1M1_1%_0.125W_100PPM) 1%
- (in symbol R0805_10M_1%_0.125W_100PPM_VISHAY_CRCW e3) 1%

### Library data of the parts
FTG1 FTG5 = FIDUCIAL_TARGET_C100-200: Fiducial Target; Part Description: Round Fiducial Target, Top Layer, 1.0mm, Top Solder 2.0mm, Keepout =2.0mm; Mounted: No; Part Number: FIDUCIAL_TARGET_C100-200; Component Kind: Standard (No BOM); Component Type: Standard (No BOM); Pin Count: 1; Family: Fiducial; Socket: No; SMD: Yes; Sense: No; Status: None; ComponentHeight: 0mm; HelpURL: Undefined; Author: CERN DEM JLC; CreateDate: 09.02.2010; LatestRevisionDate: 04.04.2012; PackageDescription: Round Fiducial Target, Top Layer, 1.0mm, Top Solder 2.0mm, Keepout =2.0mm
FTG2-FTG4 FTG6 = FIDUCIAL_TARGET_S100-200: Fiducial Target; Part Description: Square Fiducial Target, Top Layer, 1.0mm, Top Solder 2.0mm, Keepout =2.0mm; Mounted: No; Part Number: FIDUCIAL_TARGET_S100-200; Component Kind: Standard (No BOM); Component Type: Standard (No BOM); Pin Count: 1; Family: Fiducial; Socket: No; SMD: Yes; Sense: No; Status: None; ComponentHeight: 0mm; HelpURL: Undefined; Author: CERN DEM JLC; CreateDate: 09.02.2010; LatestRevisionDate: 04.04.2012; PackageDescription: Square Fiducial Target, Top Layer, 1.0mm, Top Solder 2.0mm, Keepout =2.0mm
LOGO1 = CMP-00028-00007-2: ARTIQ logo to place on the PCB
Logo2 = CMP-00028-00009-2: Placeholder for QR code with PN
M3-M8 = CMP-00028-00020-1: Plated Hole for screw 3mm

## Sheet Mezzaine_connector.SchDoc: =DocumentName
size A4; DocumentNumber: 1; Revision: 0; SheetNumber: 6; SheetTotal: 6
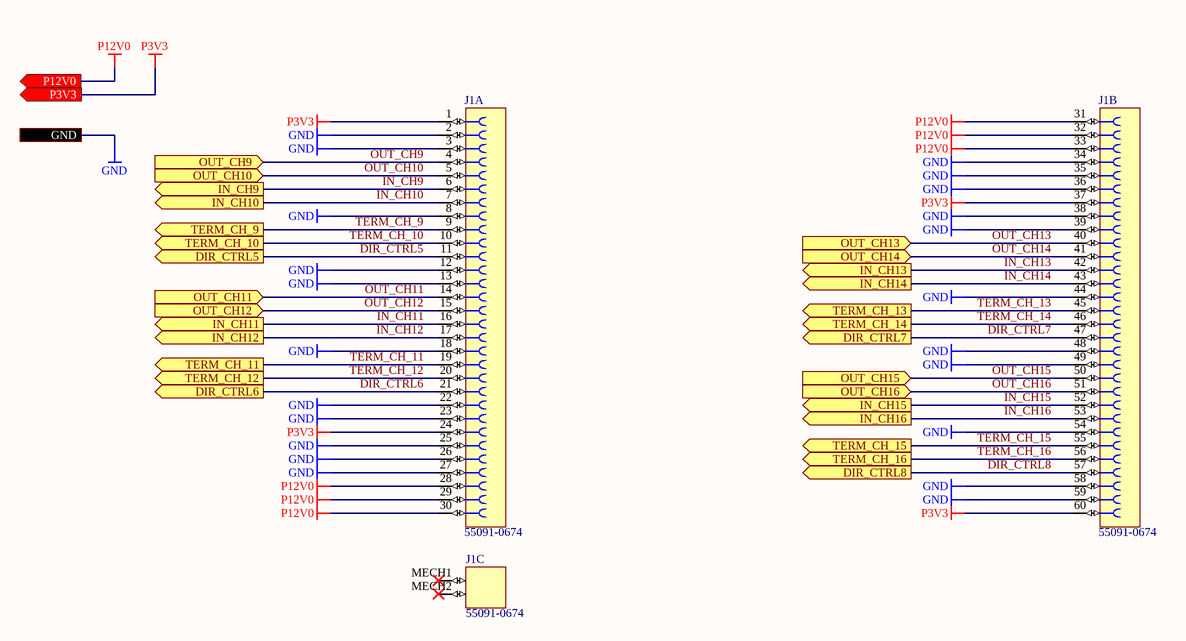
[diagram p5: Mezzaine_connector.SchDoc]

### Parts
J1  55091-0674  [55091-0674]  (parts A,B,C of 3)

### Ports
DIR_CTRL5 (out), DIR_CTRL6 (out), DIR_CTRL7 (out), DIR_CTRL8 (out), GND, IN_CH9 (out), IN_CH10 (out), IN_CH11 (out), IN_CH12 (out), IN_CH13 (out), IN_CH14 (out), IN_CH15 (out), IN_CH16 (out), OUT_CH9 (in), OUT_CH10 (in), OUT_CH11 (in), OUT_CH12 (in), OUT_CH13 (in), OUT_CH14 (in), OUT_CH15 (in), OUT_CH16 (in), P3V3 (out), P12V0 (out), TERM_CH_9 (out), TERM_CH_10 (out), TERM_CH_11 (out), TERM_CH_12 (out), TERM_CH_13 (out), TERM_CH_14 (out), TERM_CH_15 (out), TERM_CH_16 (out)

### Nets
GND: J1.2 J1.3 J1.8 J1.12 J1.13 J1.18 J1.22 J1.23 J1.25 J1.26 J1.27 J1.34 J1.35 J1.36 J1.38 J1.39 J1.44 J1.48 J1.49 J1.54 J1.58 J1.59 ; port GND
P3V3: J1.1 J1.24 J1.37 J1.60 ; port P3V3
P12V0: J1.28 J1.29 J1.30 J1.31 J1.32 J1.33 ; port P12V0
DIR_CTRL5: J1.11 ; port DIR_CTRL5
DIR_CTRL6: J1.21 ; port DIR_CTRL6
DIR_CTRL7: J1.47 ; port DIR_CTRL7
DIR_CTRL8: J1.57 ; port DIR_CTRL8
IN_CH9: J1.6 ; port IN_CH9
IN_CH10: J1.7 ; port IN_CH10
IN_CH11: J1.16 ; port IN_CH11
IN_CH12: J1.17 ; port IN_CH12
IN_CH13: J1.42 ; port IN_CH13
IN_CH14: J1.43 ; port IN_CH14
IN_CH15: J1.52 ; port IN_CH15
IN_CH16: J1.53 ; port IN_CH16
OUT_CH9: J1.4 ; port OUT_CH9
OUT_CH10: J1.5 ; port OUT_CH10
OUT_CH11: J1.14 ; port OUT_CH11
OUT_CH12: J1.15 ; port OUT_CH12
OUT_CH13: J1.40 ; port OUT_CH13
OUT_CH14: J1.41 ; port OUT_CH14
OUT_CH15: J1.50 ; port OUT_CH15
OUT_CH16: J1.51 ; port OUT_CH16
TERM_CH_9: J1.9 ; port TERM_CH_9
TERM_CH_10: J1.10 ; port TERM_CH_10
TERM_CH_11: J1.19 ; port TERM_CH_11
TERM_CH_12: J1.20 ; port TERM_CH_12
TERM_CH_13: J1.45 ; port TERM_CH_13
TERM_CH_14: J1.46 ; port TERM_CH_14
TERM_CH_15: J1.55 ; port TERM_CH_15
TERM_CH_16: J1.56 ; port TERM_CH_16

Not connected (* = marked no-connect by the designer): J1 MECH1* MECH2*

### Notes on the sheet
- Release
- Last modified =ModifiedDate
  Sheet =sheetnumber of =sheettotal · Size A4
- Copyright =P_copyright_owner
  This source describes Open Hardware and is licensed under the CERN-OHL-W v2. You may redistribute and modify this source and make products using it under the terms of the CERN-OHL-W v2 (https://cern.ch/cern-ohl). This source is distributed WITHOUT ANY EXPRESS OR IMPLIED WARRANTY, INCLUDING OF MERCHANTABILITY, SATISFACTORY QUALITY AND FITNESS FOR A PARTICULAR PURPOSE. Please see the CERN-OHL-W v2 for applicable conditions.
  Notice: If You produce hardware based on this source, You must maintain the Source Location visible on the product, its packaging or its documentation.
- SINARA OPEN HARDWARE
- OPEN HARDWARE FOR SCIENTIFIC INSTRUMENTATION
- https://github.com/sinara-hw
- Release owner
- Designers
- Reviewers
- Source location:

### Library data of the parts
J1 = CMP-002-04666-1: Header Connector, PCB Mount, RECEPT, 60 Contacts, PIN, 0.025 Pitch, SURFACE MOUNT Term; Manufacturer: Molex; Manufacturer Part Number: 0550910674; Mounting Technology: Surface Mount; Max Operating Temperature: 85°C; Pins: 60; Number of Rows: 2; Case/Package: Metal; Min Operating Temperature: -55°C

## Nets that join several sheets
GND: Bank_5/ISO_DCDC (5 pins), Bank_5/Bank (6 pins), Bank_6/ISO_DCDC (5 pins), Bank_6/Bank (6 pins), Bank_7/ISO_DCDC (5 pins), Bank_7/Bank (6 pins), Bank_8/ISO_DCDC (5 pins), Bank_8/Bank (6 pins), Mezzaine_connector (22 pins)
GND_ISO: Bank_5/ISO_DCDC (5 pins), Bank_5/Bank (33 pins)
GND_ISO: Bank_6/ISO_DCDC (5 pins), Bank_6/Bank (33 pins)
GND_ISO: Bank_7/ISO_DCDC (5 pins), Bank_7/Bank (33 pins)
GND_ISO: Bank_8/ISO_DCDC (5 pins), Bank_8/Bank (33 pins)
P3V3: Bank_5/Bank (8 pins), Bank_6/Bank (8 pins), Bank_7/Bank (8 pins), Bank_8/Bank (8 pins), Mezzaine_connector (J1.1 J1.24 J1.37 J1.60)
P5V0_ISO: Bank_5/ISO_DCDC (C42A.1 C43A.2 L5A.1), Bank_5/Bank (18 pins)
P5V0_ISO: Bank_6/ISO_DCDC (C42B.1 C43B.2 L5B.1), Bank_6/Bank (18 pins)
P5V0_ISO: Bank_7/ISO_DCDC (C42C.1 C43C.2 L5C.1), Bank_7/Bank (18 pins)
P5V0_ISO: Bank_8/ISO_DCDC (C42D.1 C43D.2 L5D.1), Bank_8/Bank (18 pins)
P12V0: Bank_5/ISO_DCDC (C39A.1 C41A.2 L11A.2), Bank_6/ISO_DCDC (C39B.1 C41B.2 L11B.2), Bank_7/ISO_DCDC (C39C.1 C41C.2 L11C.2), Bank_8/ISO_DCDC (C39D.1 C41D.2 L11D.2), Mezzaine_connector (6 pins)
DIR_CTRL5: Bank_5/Bank (IC54A.3), Mezzaine_connector (J1.11)
DIR_CTRL6: Bank_6/Bank (IC54B.3), Mezzaine_connector (J1.21)
DIR_CTRL7: Bank_7/Bank (IC54C.3), Mezzaine_connector (J1.47)
DIR_CTRL8: Bank_8/Bank (IC54D.3), Mezzaine_connector (J1.57)
IN_CH9: Bank_5/Bank (B6A.1 IC53A.6), Mezzaine_connector (J1.6)
IN_CH10: Bank_5/Bank (B5A.1 IC53A.5), Mezzaine_connector (J1.7)
IN_CH11: Bank_6/Bank (B6B.1 IC53B.6), Mezzaine_connector (J1.16)
IN_CH12: Bank_6/Bank (B5B.1 IC53B.5), Mezzaine_connector (J1.17)
IN_CH13: Bank_7/Bank (B6C.1 IC53C.6), Mezzaine_connector (J1.42)
IN_CH14: Bank_7/Bank (B5C.1 IC53C.5), Mezzaine_connector (J1.43)
IN_CH15: Bank_8/Bank (B6D.1 IC53D.6), Mezzaine_connector (J1.52)
IN_CH16: Bank_8/Bank (B5D.1 IC53D.5), Mezzaine_connector (J1.53)
OUT_CH9: Bank_5/Bank (B2A.1 IC52A.12), Mezzaine_connector (J1.4)
OUT_CH10: Bank_5/Bank (B4A.1 IC52A.11), Mezzaine_connector (J1.5)
OUT_CH11: Bank_6/Bank (B2B.1 IC52B.12), Mezzaine_connector (J1.14)
OUT_CH12: Bank_6/Bank (B4B.1 IC52B.11), Mezzaine_connector (J1.15)
OUT_CH13: Bank_7/Bank (B2C.1 IC52C.12), Mezzaine_connector (J1.40)
OUT_CH14: Bank_7/Bank (B4C.1 IC52C.11), Mezzaine_connector (J1.41)
OUT_CH15: Bank_8/Bank (B2D.1 IC52D.12), Mezzaine_connector (J1.50)
OUT_CH16: Bank_8/Bank (B4D.1 IC52D.11), Mezzaine_connector (J1.51)
TERM_CH_9: Bank_5/Bank (IC10A.4), Mezzaine_connector (J1.9)
TERM_CH_10: Bank_5/Bank (IC10A.2), Mezzaine_connector (J1.10)
TERM_CH_11: Bank_6/Bank (IC10B.4), Mezzaine_connector (J1.19)
TERM_CH_12: Bank_6/Bank (IC10B.2), Mezzaine_connector (J1.20)
TERM_CH_13: Bank_7/Bank (IC10C.4), Mezzaine_connector (J1.45)
TERM_CH_14: Bank_7/Bank (IC10C.2), Mezzaine_connector (J1.46)
TERM_CH_15: Bank_8/Bank (IC10D.4), Mezzaine_connector (J1.55)
TERM_CH_16: Bank_8/Bank (IC10D.2), Mezzaine_connector (J1.56)

## Assembly variants
Isolated: not fitted IC12A IC12B IC12C IC12D R69A R69B R69C R69D